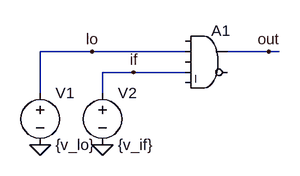
[diagram p0: schematic Draft1.asc]
Draft1.asc, the LTspice schematic file:
Version 4.1
SHEET 1 880 680
WIRE 48 176 -32 176
WIRE 192 176 48 176
WIRE 320 176 256 176
WIRE 336 176 320 176
WIRE 112 208 64 208
WIRE 192 208 112 208
WIRE -32 240 -32 176
WIRE 64 240 64 208
FLAG -32 320 0
FLAG 64 320 0
FLAG 320 176 out
FLAG 48 176 lo
FLAG 112 208 if
SYMBOL Digital\\and 224 128 R0
SYMATTR InstName A1
SYMBOL voltage -32 224 R0
SYMATTR InstName V1
SYMATTR Value {v_lo}
SYMBOL voltage 64 224 R0
SYMATTR InstName V2
SYMATTR Value {v_if}

The netlist it stands for:
* Draft1.asc
A1 0 lo 0 if 0 0 out 0 AND
V1 lo 0 {v_lo}
V2 if 0 {v_if}
.backanno
.end